# EAGLE design Adafruit NeoPot Breakout (EAGLE 9.6.2)
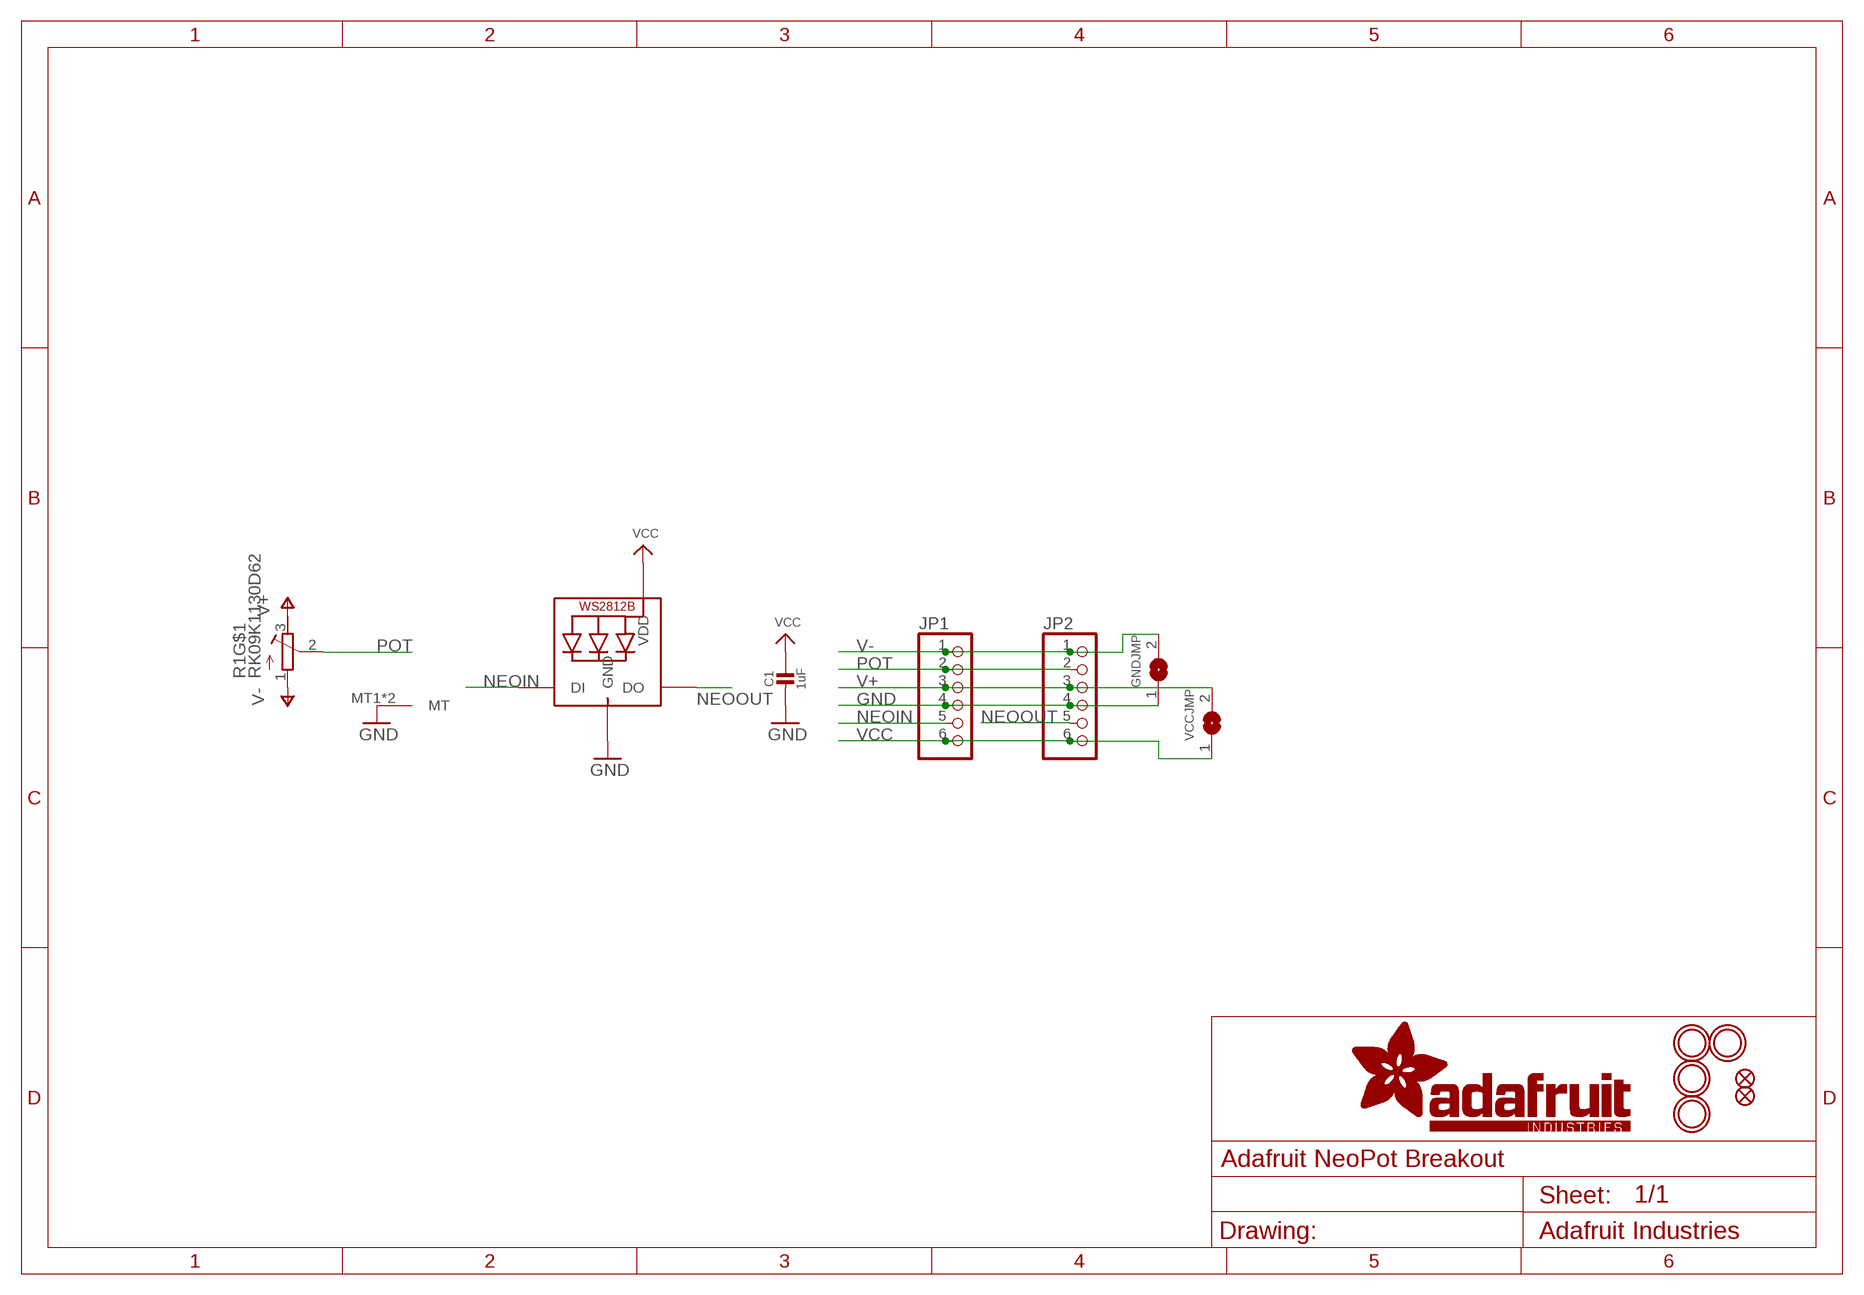
[diagram p0: schematic, sheet 1]

## Parts
C1  1uF  CAP_CERAMIC0603_NO  [0603-NO]
FID1  FIDUCIAL_0.5MM  [FIDUCIAL_0.5MM]
FID2  FIDUCIAL_0.5MM  [FIDUCIAL_0.5MM]
GNDJMP  SOLDERJUMPER  [SOLDERJUMPER_ARROW_NOPASTE]
JP1  HEADER-1X676MIL  [1X06_ROUND_76]
JP2  HEADER-1X676MIL  [1X06_ROUND_76]
LED1  SK6812-3535  WS2812B_SK6812_2020  [SK6812_2020]
R1  RK09K1130D62  POTENTIOMETER_MNT_RK09  [POT_RK09]
U$2  MOUNTINGHOLE2.5  [MOUNTINGHOLE_2.5_PLATED]
U$3  MOUNTINGHOLE2.5  [MOUNTINGHOLE_2.5_PLATED]
U$4  MOUNTINGHOLE2.5  [MOUNTINGHOLE_2.5_PLATED]
U$5  MOUNTINGHOLE2.5  [MOUNTINGHOLE_2.5_PLATED]
VCCJMP  SOLDERJUMPER  [SOLDERJUMPER_ARROW_NOPASTE]

## Nets
GND: C1.2 GNDJMP.1 JP1.4 JP2.4 LED1.3(GND) R1.MT1(MT) R1.MT2(MT)
NEOIN: JP1.5 LED1.4(DI)
NEOOUT: JP2.5 LED1.2(DO)
POT: JP1.2 JP2.2 R1.2(S)
V+: JP1.3 JP2.3 R1.3(E) VCCJMP.2
V-: GNDJMP.2 JP1.1 JP2.1 R1.1(A)
VCC: C1.1 JP1.6 JP2.6 LED1.1(VDD) VCCJMP.1

## Library data of the parts
C1 = microbuilder:CAP_CERAMIC: Ceramic Capacitors For new designs, use the packages preceded by an '_' character since they are more reliable: The following footprints should be used on most boards: _0402 - Standard footprint for regular board layouts _0603 - Standard footprint for regular board layouts _0805 - Standard footprint for regular board layouts _1206 - Standard footprint for regular board layouts For extremely tight-pitch boards where space is at a premium, the following 'micro-pitch' footprints can be used (smaller pads, no silkscreen outline, etc.): _0402MP - Micro-pitch footprint for very dense/compact boards _0603MP - Micro-pitch footprint for very dense/compact boards _0805MP - Micro-pitch footprint for very dense/compact boards _1206MP - Micro-pitch footprint for very dense/compact boards
FID1 FID2 = microbuilder:FIDUCIAL: Fiducial Alignment Points Various fiducial points for machine vision alignment.
GNDJMP VCCJMP = microbuilder:SOLDERJUMPER: SMD Solder JUMPER Solder the two pads together to create a connection, or remove the solder to break it. REFLOW - Use this footprint for solder paste and reflow ovens. WAVE - Use this footprint for hand-soldering (larger pads). CLOSED - Has a trace between the two pads to ensure it is closed by default. The trace needs to be cut to disable the jumper, and can be closed again by creating a solder bridge between the two pads.; BOM: EXCLUDE
JP1 JP2 = microbuilder:HEADER-1X6: PIN HEADER
LED1 = microbuilder:WS2812B
R1 = adafruit_electromech:POTENTIOMETER_MNT: Trimm resistor
U$2-U$5 = adafruit_electromech:MOUNTINGHOLE: Mounting Hole For #2 screws (0.086"/2.18mm width, 0.094"/2.4mm hole) use 2.5mm; BOM: EXCLUDE

## Board
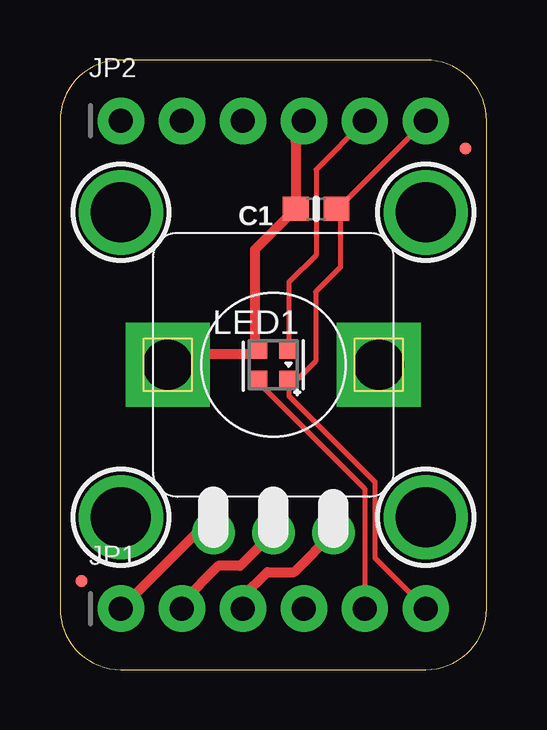
[diagram p1: board, top side]
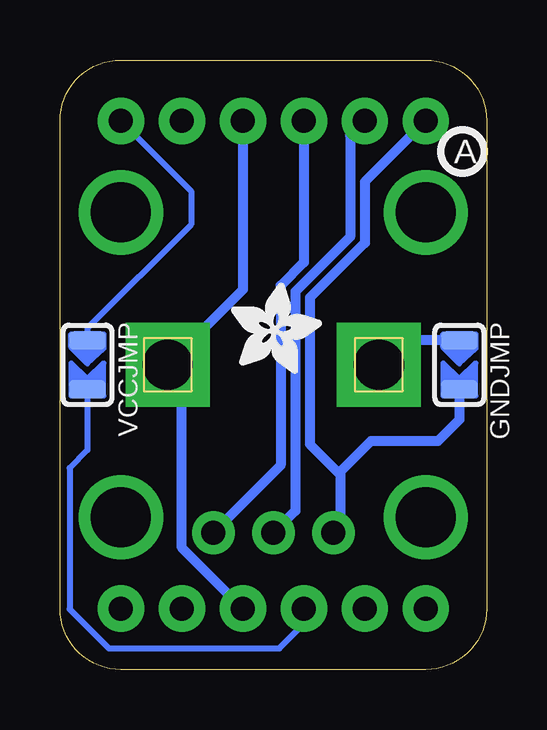
[diagram p2: board, bottom side, seen from below]

Size 17.78 x 25.4 mm. Coordinates in mm from the lower left corner, seen from the top.
Outline: 2.54,0 15.24,0 arc90 17.78,2.54 17.78,22.86 arc90 15.24,25.4 2.54,25.4 arc90 0,22.86 0,2.54 arc90 2.54,0
Copper layers (1*16): Top 0.035mm / dielectric 1.5mm / Bottom 0.035mm
Design rules "adafruit *": minimum track width 8mil, minimum drill 15.5mil, track to track 8mil, track to pad 8mil, pad to pad 8mil, via to via 8mil, smd to smd 8mil, copper to edge 10mil, drill to drill 8mil, minimum pad ring 10mil, minimum via ring 8mil, stop-mask expansion 2mil, vias tented up to drill 20mil, thermal gap 10mil

### Footprints (pad centres in the part's own frame; a part is rotated, then mirrored left to right if it is on the bottom)
0603-NO = smd 1.075 x 1: 1 -0.85,0; 2 0.85,0
FIDUCIAL_0.5MM = smd 0.5 x 0.5: 1 0,0
SOLDERJUMPER_ARROW_NOPASTE = smd 0.762 x 1.524: 1 -1.016,0; 2 1.016,0
1X06_ROUND_76 = drill 1 pad 1.93: 1 -6.35,0; 2 -3.81,0; 3 -1.27,0; 4 1.27,0; 5 3.81,0; 6 6.35,0
SK6812_2020 = smd 0.8 x 0.7: 1 0.65,-0.6; 2 0.65,0.6; 3 -0.65,0.6; 4 -0.65,-0.6
POT_RK09 = drill 1 pad 1.778: 1 -2.5,-7; 2 0,-7; 3 2.5,-7 | drill 2.1 pad 3.5 square: MT1 -4.4,0; MT2 4.4,0
MOUNTINGHOLE_2.5_PLATED = drill 2.5 pad 3.2: P$1 0,0

### Placement (x,y rotation side)
C1  10.67,19.2 180 top
FID1  0.89,3.68 0 top
FID2  16.89,21.72 0 top
GNDJMP  1.14,12.7 270 bottom
JP1  8.89,2.54 0 top
JP2  8.89,22.86 0 top
LED1  8.89,12.7 0 top
PLABEL0  [PLABEL0]  2.54,1.02 0 top
PLABEL1  [PLABEL1]  2.54,24.38 0 top
PLABEL2  [PLABEL2]  5.46,21.21 0 top
PLABEL3  [PLABEL3]  5.33,4.19 0 top
PLABEL4  [PLABEL4]  7.87,0.89 0 top
PLABEL5  [PLABEL5]  7.87,24.51 0 top
PLABEL6  [PLABEL6]  10.16,21.21 0 top
PLABEL7  [PLABEL7]  10.16,4.19 0 top
PLABEL8  [PLABEL8]  12.32,0.89 0 top
PLABEL9  [PLABEL9]  12.32,24.51 0 top
PLABEL10  [PLABEL10]  15.37,0.89 0 top
PLABEL11  [PLABEL11]  15.75,24.51 0 top
PLABEL12  [PLABEL12]  1.02,12.7 90 top
PLABEL13  [PLABEL13]  16.76,12.7 90 top
PLABEL14  [PLABEL14]  8.51,18.8 0 bottom
PLABEL15  [PLABEL15]  9.02,9.4 0 bottom
PLABEL16  [PLABEL16]  1.14,10.16 90 bottom
PLABEL17  [PLABEL17]  1.27,15.11 90 bottom
PLABEL18  [PLABEL18]  16.64,15.75 90 bottom
PLABEL19  [PLABEL19]  16.76,9.91 90 bottom
R1  8.89,12.7 0 top
U$2  2.54,6.35 0 top
U$3  15.24,6.35 0 top
U$4  2.54,19.05 0 top
U$5  15.24,19.05 0 top
U$6  [PCBFEAT-REV-040]  1.02,21.59 0 bottom
U$7  [ADAFRUIT_3.5MM]  10.67,12.32 0 bottom
VCCJMP  16.64,12.7 270 bottom

### Tracks (layer width: path | path; a pad name or v marks a point on that pad's centre or on a via)
GND
  Top 0.203: 8.09,13.15 LED1.3 8.13,13.41 8.13,13.59
  Top 0.406: 8.09,13.15 4.94,13.15 R1.MT1 | JP2.4 10.16,22.35 9.82,22.01 C1.2 8.13,17.51 8.13,13.59 8.13,13.15
  Bottom 0.406: JP2.4 10.16,15.83 13.12,12.87 | 13.12,12.87 R1.MT2 | JP1.4 12.7,5.08 12.7,12.45 13.12,12.87 | GNDJMP.1 3.47,13.72 R1.MT1
NEOIN
  Top 0.203: LED1.4 8.24,11.99 12.7,7.53 JP1.5
NEOOUT
  Top 0.203: JP2.5 10.67,20.83 10.67,17.27 9.54,16.14 LED1.2
POT
  Top 0.406: R1.2 7.51,4.32 6.6,4.32 5.08,2.79 JP1.2
  Bottom 0.406: JP2.2 5.69,22.25 5.69,18.03 7.98,15.75 7.98,6.61 R1.2
V+
  Top 0.406: R1.3 9.75,4.06 8.64,4.06 7.62,3.05 JP1.3
  Bottom 0.254: VCCJMP.2 16.64,9.14 17.38,8.4 17.38,2.52 15.75,0.89 8.64,0.89 7.62,1.9 JP1.3
  Bottom 0.406: JP2.3 7.62,16.96 8.59,16 8.59,8.5 R1.3
V-
  Top 0.406: R1.1 5.7,5.7 JP1.1
  Bottom 0.406: JP2.1 5.08,20.32 5.08,17.78 7.37,15.49 7.37,9.4 6.16,8.19 | 6.16,8.19 6.1,8.13 6.1,5.99 R1.1 | GNDJMP.2 1.14,10.41 2.03,9.52 4.83,9.52 6.16,8.19
VCC
  Top 0.203: JP1.6 13.12,4.66 13.12,7.83 9.54,11.41 LED1.1 9.9,12.1 10.65,12.86 10.65,15.73 11.68,16.76 11.68,19.3 | 11.68,19.3 JP2.6 | C1.1 11.62,19.3 11.68,19.3
  Bottom 0.254: JP2.6 12.32,19.94 12.32,18.54 16.64,14.22 VCCJMP.1

### Text on the board
Pinguin_tBackup: P- | P+ | NOut | Vcc | POT | GND | NeoPixel | Potentio. | POT | GND | P- | P+ | NIn | Vcc
Pinguin_bBackup: NeoPixel / RGB LED / Potentiometer | Vcc | G | V- | 10KΩ / RK09K1130D62 / Vcc:3~5V | V+